# Altium project 6-gear.PrjPcb
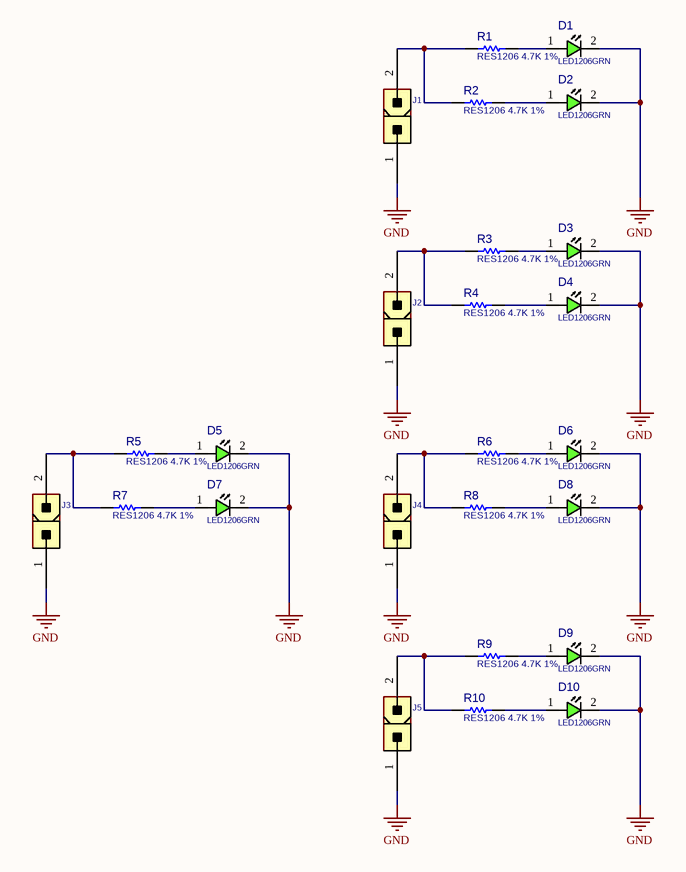
[diagram p0: gear.SchDoc]
1 sheet, 25 parts. Net scope: global (net labels, ports and power ports of the same name join across sheets).
Board file: PCB1.PcbDoc

## Sheet gear.SchDoc
size A4; SheetNumber: 1; SheetTotal: 1

### Parts
D1  LED1206GRN  [LED1206GRN]
D2  LED1206GRN  [LED1206GRN]
D3  LED1206GRN  [LED1206GRN]
D4  LED1206GRN  [LED1206GRN]
D5  LED1206GRN  [LED1206GRN]
D6  LED1206GRN  [LED1206GRN]
D7  LED1206GRN  [LED1206GRN]
D8  LED1206GRN  [LED1206GRN]
D9  LED1206GRN  [LED1206GRN]
D10  LED1206GRN  [LED1206GRN]
J1  CONN_ATXPWR_2  [ATXPWR_2]  (value not drawn)
J2  CONN_ATXPWR_2  [ATXPWR_2]  (value not drawn)
J3  CONN_ATXPWR_2  [ATXPWR_2]  (value not drawn)
J4  CONN_ATXPWR_2  [ATXPWR_2]  (value not drawn)
J5  CONN_ATXPWR_2  [ATXPWR_2]  (value not drawn)
R1  RES1206 4.7K 1%  [R1206]
R2  RES1206 4.7K 1%  [R1206]
R3  RES1206 4.7K 1%  [R1206]
R4  RES1206 4.7K 1%  [R1206]
R5  RES1206 4.7K 1%  [R1206]
R6  RES1206 4.7K 1%  [R1206]
R7  RES1206 4.7K 1%  [R1206]
R8  RES1206 4.7K 1%  [R1206]
R9  RES1206 4.7K 1%  [R1206]
R10  RES1206 4.7K 1%  [R1206]

### Nets
GND: D1.2(CATHODE) D2.2(CATHODE) D3.2(CATHODE) D4.2(CATHODE) D5.2(CATHODE) D6.2(CATHODE) D7.2(CATHODE) D8.2(CATHODE) D9.2(CATHODE) D10.2(CATHODE) J1.1 J2.1 J3.1 J4.1 J5.1
NetD1_1: D1.1(ANODE) R1.1
NetD2_1: D2.1(ANODE) R2.1
NetD3_1: D3.1(ANODE) R3.1
NetD4_1: D4.1(ANODE) R4.1
NetD5_1: D5.1(ANODE) R5.1
NetD6_1: D6.1(ANODE) R6.1
NetD7_1: D7.1(ANODE) R7.1
NetD8_1: D8.1(ANODE) R8.1
NetD9_1: D9.1(ANODE) R9.1
NetD10_1: D10.1(ANODE) R10.1
NetJ1_2: J1.2 R1.2 R2.2
NetJ2_2: J2.2 R3.2 R4.2
NetJ3_2: J3.2 R5.2 R7.2
NetJ4_2: J4.2 R6.2 R8.2
NetJ5_2: J5.2 R9.2 R10.2

### Library data of the parts
D1-D10 = LED_SMD_1206_GRN: LED, SMD, 1206, GREEN; PARAM: 20mA; DESC: DESCRIPTION; PARAM2: 2.2V; MANF: -; ASSEMBLY: ASSEMBLY; PRICE: 36t@Javan; MANF_P#: -; VALUE: LED1206GRN; MountType: SMT; PartType: LED
J1-J5 = CONN_ATXPWR_2: CONN, ATX POWER, 2 P; MANF: Molex; MANF_P#: 39281023; VALUE: CONN_ATXPWR_2; MountType: THD; PACKAGE: ATXPWR-2pin; Part Type: Conn.
R1-R10 = RES_SMD_1206: RESISTOR, SMD; PARAM: 1%, 0.25W; DESC: DESCRIPTION; DIST#: MOUSER; MANF_P#: -; MANF: -; ASSEMBLY: ASSEMBLY; PRICE: -; PARAM2: -